# Altium schematic sheet iR_Receiver_Section.SchDoc: =Projectname
size A4; SheetNumber: 3; SheetTotal: 4
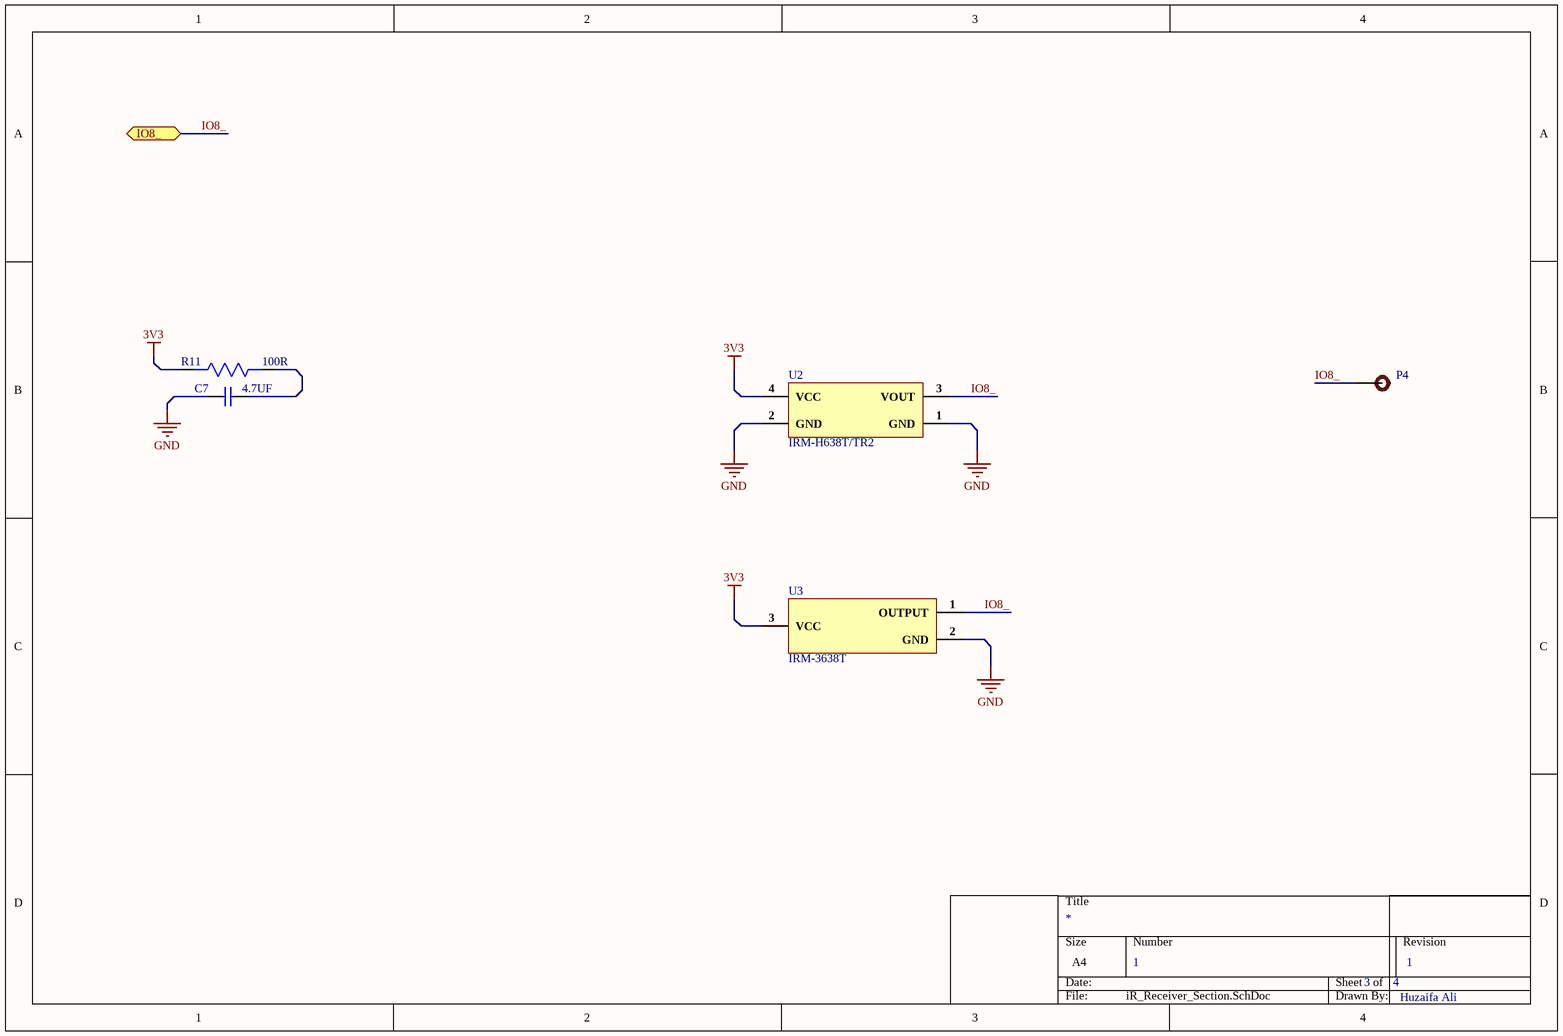
[diagram p0: iR_Receiver_Section.SchDoc]

## Parts
C7  4.7UF  [Cap-0603]
P4  TEST POINT  [Test-point]  (value not drawn)
R11  100R  [Res-0603]
U2  IRM-H638T/TR2  [SMD-4,4x5mm]
U3  IRM-3638T  [SIP-3P-2.54mm]

## Ports
IO8_ (bidir)

## Nets
3V3: R11.2 U2.4(VCC) U3.3(VCC)
GND: C7.1 U2.1(GND) U2.2(GND) U3.2(GND)
IO8_: P4.1 U2.3(VOUT) U3.1(OUTPUT) ; port IO8_
NetC7_2: C7.2 R11.1

## Notes on the sheet
- 1
- Huzaifa Ali

## Library data of the parts
C7 = CL10A475KA8NQNC: CAP CER 4.7UF 25V X5R 0603; Manufacturer: Samsung; Tolerance: 10%; Supplier 1: Digi-Key; Manufacturer Part Number: CL10A475KA8NQNC; Stock 1: 2252340; Pricing 1: 1=0.37, 10=0.255, 100=0.1528, 500=0.11456, 1000=0.09675 (USD); Mount: Surface Mount; Case/Package: 0603; Case Code (Metric): 1608; Case Code (Imperial): 0603; Contact Plating: Tin; Min Operating Temperature: -55°C; Max Operating Temperature: 85°C; Package Quantity: 1; Packaging: Tape and Reel; Capacitance: 4.7uF; Voltage Rating: 25V; Dielectric: X5R; Termination: Wraparound; Length: 1.6mm; Width: 0.031inch; Thickness: 0.035inch; Depth: 0.8mm; Lead Free: Lead Free; ComponentLink1URL: http://www.samsungsem.com/kr/support/product-search/mlcc/CL10A475KA8NQNC.jsp?src-supplier=Digi-Key; ComponentLink1Description: http://www.samsungsem.com/kr/support/product-search/mlcc/CL10A475KA8NQNC.jsp?src-supplier=Digi-Key; Supplier Part Number 1: 1276-1900-1-ND; LCSC Part Number: C69335
P4 = TEST POINT: Test Point ON
R11 = RC0603FR-07100RL: RES SMD 100 OHM 1% 1/10W 0603; Manufacturer: Yageo; Temperature Coefficient: 100ppm/°C; Voltage Rating (DC): 50V; Power Rating: 100mW; Supplier 1: Arrow Electronics; Manufacturer Part Number: RC0603FR-07100RL; RoHS: Yes; Category: Chip SMD Resistors; Stock 1: 3800000; Pricing 1: 5000=0.00300, 5000=0.00200, 5000=0.00450, 50000=0.00410, 500000=0.00230, 2500000=0.00140 (USD); Case/Package: 0603; Number of Pins: 2; Case Code (Imperial): 0603; Case Code (Metric): 1608; Size Code: 0603; Min Operating Temperature: -55°C; Max Operating Temperature: 155°C; Resistance: 100R; Tolerance: 1%; Resistor Type: Thick Film; Packaging: Tape and Reel; Voltage Rating: 50V; Termination: SMD/SMT; Features: Moisture Resistant; Series: RC; Max Power Dissipation: 100mW; Number of Terminations: 2; Construction: Rectangular; Resistance Tolerance: 1%; Technology: THICK FILM; Length: 1.6mm; Width: 0.8mm; Height: 0.45mm; Depth: 0.8mm; REACH SVHC: Unknown; Lead Free: Lead Free; RoHS Compliant: Yes; Military Standard: Not; Supplier Part Number 1: RC0603FR-07100RL; LCSC Part Number: C105588
U2 = IRM-H638T/TR2: IRM-H6 Series External Dimensions 5 x 7 x 4 mm SMT Infrared Receiver; Manufacturer: Everlight; Sensing Distance: 8m; Operating Supply Current: 1.2mA; Operating Supply Voltage: 5.5V; Item Type: IC; Supplier 1: Future Electronics; Manufacturer Part Number: IRM-H638T/TR2; RoHS: Yes; Category: Optical Sensors; Pricing 1: 1000=0.53500, 2000=0.52000, 3000=0.51500, 4000=0.51000, 5000=0.49500 (USD); Mount: Surface Mount; Number of Pins: 4; Min Operating Temperature: -25°C; Max Operating Temperature: 85°C; Packaging: Tape and Reel; Package Quantity: 2000; Orientation: Top View; Lead Free: Lead Free; RoHS Compliant: Yes; ComponentLink1URL: https://datasheet.ciiva.com/12418/irm-h638t-tr2-41100-12418542.pdf?src-supplier=Mouser; ComponentLink1Description: https://datasheet.ciiva.com/12418/irm-h638t-tr2-41100-12418542.pdf?src-supplier=Mouser; Supplier Part Number 1: 5043152; LCSC Part Number: C91447
U3 = IRM-3638T: SENSOR REMOTE REC 38.0KHZ 14M; Manufacturer: Everlight; Operating Supply Current: 1mA; Min Output Voltage: 2.7V; Operating Supply Voltage: 5.5V; Item Type: IC; Supplier 1: Future Electronics; Manufacturer Part Number: IRM-3638T; RoHS: Yes; Category: Optical Sensors; Pricing 1: 250=0.20500, 1500=0.19700, 5000=0.19000, 10000=0.18600, 20000=0.18000 (USD); Mount: Through Hole; Case/Package: Module; Number of Pins: 3; Min Operating Temperature: -25°C; Max Operating Temperature: 80°C; Package Quantity: 250; Series: -; Sensing Distance: 14m; Orientation: Side View; RoHS Compliant: Yes; ComponentLink1URL: https://datasheet.ciiva.com/12418/irm-3636t-27149-12418050.pdf?src-supplier=Mouser; ComponentLink1Description: https://datasheet.ciiva.com/12418/irm-3636t-27149-12418050.pdf?src-supplier=Mouser; ComponentLink2URL: https://datasheet.ciiva.com/2821/irm-36xxt-series-2821351.pdf?src-supplier=Digi-Key; ComponentLink2Description: https://datasheet.ciiva.com/2821/irm-36xxt-series-2821351.pdf?src-supplier=Digi-Key; LCSC Part Number: C16216; Supplier Part Number 1: 2052908